# Altium schematic sheet 03_Drivers_and_Sonar.SchDoc: MOTOR DRIVERS AND SENSOR INTERFACE
size 406 x 279 mm; Revision: A - DRAFT; Date: 2026-11-18; SheetNumber: 3; SheetTotal: 3; Author: Sarbfateh Suppal; DocumentNumber: ROVER-A-3; ProjectName: Four-motor Rover Carrier
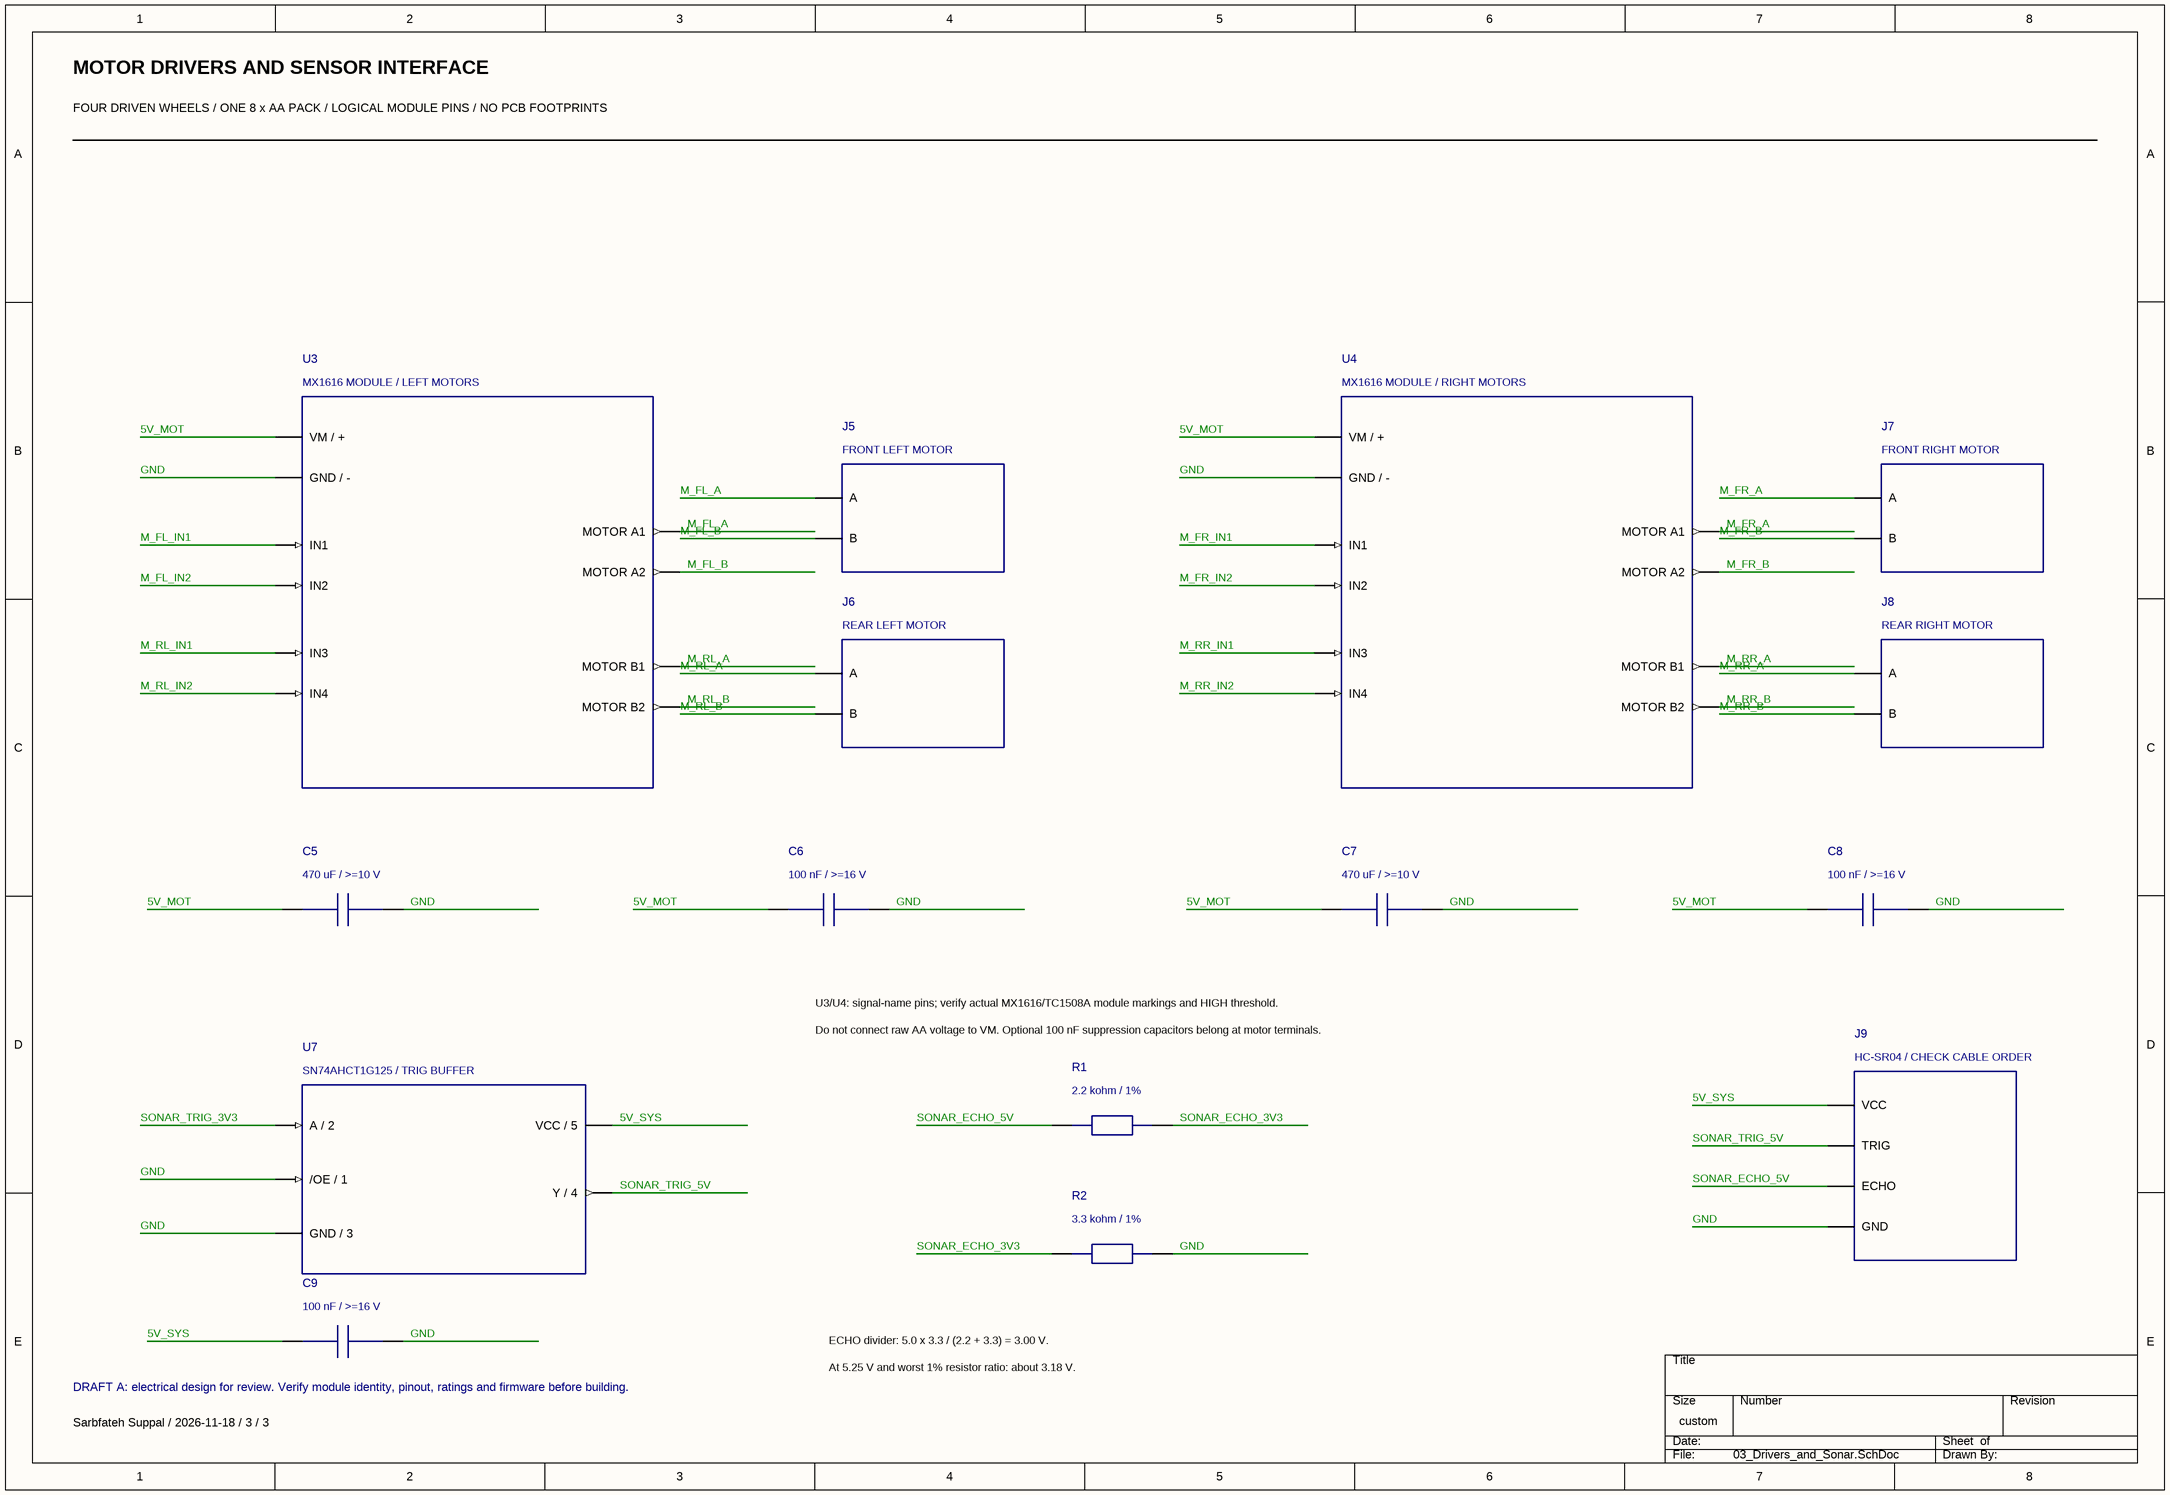
[diagram p0: 03_Drivers_and_Sonar.SchDoc]

## Parts
C5  470 uF / >=10 V
C6  100 nF / >=16 V
C7  470 uF / >=10 V
C8  100 nF / >=16 V
C9  100 nF / >=16 V
J5  FRONT LEFT MOTOR
J6  REAR LEFT MOTOR
J7  FRONT RIGHT MOTOR
J8  REAR RIGHT MOTOR
J9  HC-SR04 / CHECK CABLE ORDER
R1  2.2 kohm / 1%
R2  3.3 kohm / 1%
U3  MX1616 MODULE / LEFT MOTORS
U4  MX1616 MODULE / RIGHT MOTORS
U7  SN74AHCT1G125 / TRIG BUFFER

## Nets
5V_MOT: C5.1 C6.1 C7.1 C8.1 U3.VM(VM_/_+) U4.VM(VM_/_+)
5V_SYS: C9.1 J9.1(VCC) U7.5(VCC_/_5)
GND: C5.2 C6.2 C7.2 C8.2 C9.2 J9.4(GND) R2.2 U3.GND(GND_/_-) U4.GND(GND_/_-) U7.1(/OE_/_1) U7.3(GND_/_3)
M_FL_A: J5.1(A) U3.A1(MOTOR_A1)
M_FL_B: J5.2(B) U3.A2(MOTOR_A2)
M_FL_IN1: U3.IN1
M_FL_IN2: U3.IN2
M_FR_A: J7.1(A) U4.A1(MOTOR_A1)
M_FR_B: J7.2(B) U4.A2(MOTOR_A2)
M_FR_IN1: U4.IN1
M_FR_IN2: U4.IN2
M_RL_A: J6.1(A) U3.B1(MOTOR_B1)
M_RL_B: J6.2(B) U3.B2(MOTOR_B2)
M_RL_IN1: U3.IN3
M_RL_IN2: U3.IN4
M_RR_A: J8.1(A) U4.B1(MOTOR_B1)
M_RR_B: J8.2(B) U4.B2(MOTOR_B2)
M_RR_IN1: U4.IN3
M_RR_IN2: U4.IN4
SONAR_ECHO_3V3: R1.2 R2.1
SONAR_ECHO_5V: J9.3(ECHO) R1.1
SONAR_TRIG_3V3: U7.2(A_/_2)
SONAR_TRIG_5V: J9.2(TRIG) U7.4(Y_/_4)

## Notes on the sheet
- MOTOR DRIVERS AND SENSOR INTERFACE
- FOUR DRIVEN WHEELS / ONE 8 x AA PACK / LOGICAL MODULE PINS / NO PCB FOOTPRINTS
- U3/U4: signal-name pins; verify actual MX1616/TC1508A module markings and HIGH threshold.
- Do not connect raw AA voltage to VM. Optional 100 nF suppression capacitors belong at motor terminals.
- ECHO divider: 5.0 x 3.3 / (2.2 + 3.3) = 3.00 V.
- At 5.25 V and worst 1% resistor ratio: about 3.18 V.
- (near C9) DRAFT A: electrical design for review. Verify module identity, pinout, ratings and firmware before building.
- Sarbfateh Suppal / 2026-11-18 / 3 / 3

## Library data of the parts
C5 = capacitor_C5
C6 = capacitor_C6
C7 = capacitor_C7
C8 = capacitor_C8
C9 = capacitor_C9
J5 = module_J5
J6 = module_J6
J7 = module_J7
J8 = module_J8
J9 = module_J9
R1 = resistor_R1
R2 = resistor_R2
U3 = module_U3
U4 = module_U4
U7 = buffer_U7